# Altium schematic sheet Side_PCB_v1.0.SchDoc
size A4; SheetNumber: 2; SheetTotal: 2
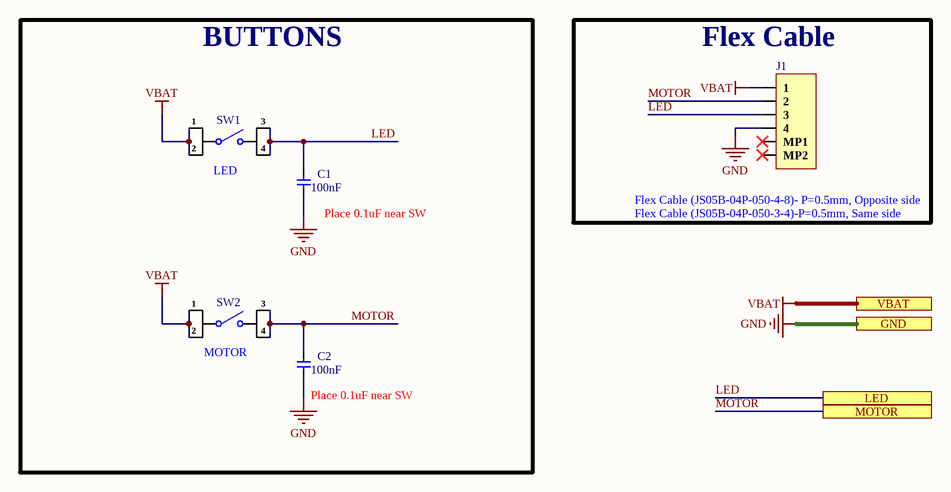
[diagram p0: Side_PCB_v1.0.SchDoc]

## Parts
C1  100nF  [CAP-0201]
C2  100nF  [CAP-0201]
J1  FH19C-4S-0.5SH(10)  [FH19C-4S-0.5SH(10)]  (value not drawn)
SW1  GT-TC025D-H0065-L1  [GT-TC025D-H0065-L1.]  (value not drawn)
SW2  GT-TC025D-H0065-L1  [GT-TC025D-H0065-L1.]  (value not drawn)

## Blocks framed on the sheet
BUTTONS: C1 C2 SW1 SW2
Flex Cable: J1

## Ports
GND, LED, MOTOR, VBAT

## Nets
GND: C1.1 C2.1 J1.4 ; port GND
VBAT: J1.1 SW1.1 SW1.2 SW2.1 SW2.2 ; port VBAT
LED: C1.2 J1.3 SW1.3 SW1.4 ; port LED
MOTOR: C2.2 J1.2 SW2.3 SW2.4 ; port MOTOR

Not connected (* = marked no-connect by the designer): J1 MP1* MP2*

## Notes on the sheet
- (near SW1) LED
- (near C1) Place 0.1uF near SW
- (near J1) Flex Cable (JS05B-04P-050-4-8)- P=0.5mm, Opposite side
- (near J1) Flex Cable (JS05B-04P-050-3-4)-P=0.5mm, Same side
- (near SW2) MOTOR
- (near C2) Place 0.1uF near SW
- File:
- Title:
- Date:
- Page
- Num:
- Total:
- Drawn By: Huzaifa Ali

## Library data of the parts
C1 C2 = CC0201KRX5R6BB104: CAP CER 0.1UF 10V X5R 0201; Manufacturer: Yageo; Tolerance: 10%; Supplier 1: Mouser; Manufacturer Part Number: CC0201KRX5R6BB104; RoHS: Yes; Category: Ceramic Capacitors; Stock 1: 824403; Pricing 1: 1=0.10000, 10=0.02400, 50=0.02400, 100=0.01900, 1000=0.01100, 10000=0.00900 (USD); Mount: Surface Mount; Case/Package: 0201; Case Code (Imperial): 0201; Case Code (Metric): 0603; Weight: 6E-06oz; Min Operating Temperature: -55°C; Max Operating Temperature: 85°C; Capacitance: 100nF; Packaging: Tape and Reel; Voltage Rating: 10V; Dielectric: X5R; Termination: SMD/SMT; Voltage Rating (DC): 10V; Length: 0.6mm; Width: 0.012inch; Thickness: 0.013inch; Lead Free: Lead Free; Halogen Free: Halogen Free; ComponentLink1URL: https://datasheet.ciiva.com/11587/upy-gphc-x5r-4v-to-50v-12-11587190.pdf?src-supplier=Avnet; ComponentLink1Description: https://datasheet.ciiva.com/11587/upy-gphc-x5r-4v-to-50v-12-11587190.pdf?src-supplier=Avnet; Supplier Part Number 1: 603-CC201KRX5R6BB104; LCSC Part Number: C190183; Resistor Type: Ceramic; Series: CC; Construction: Flat; Height: 0.3mm; Depth: 0.3mm; Radiation Hardening: No; RoHS Compliant: Yes
J1 = FH19C-4S-0.5SH(10): CONN FFC BOTTOM 4POS 0.5MM R/A; Manufacturer: Hirose; Actuator Material: Polymer,Polyphenylene,Liquid Crystal Polymer; Voltage Rating: 50V; Current Rating: 500mA; Number of Positions: 4; Insulation Resistance: 500MR; Wire/Cable Type: Flat Flex; Pitch: 0.02inch; Item Type: FPC Connector; Supplier 1: Digi-Key; Manufacturer Part Number: FH19C-4S-0.5SH(10); RoHS: Yes; Category: FFC / FPC; Stock 1: 7956; Pricing 1: 1=1.08, 10=0.916, 25=0.878, 50=0.8596, 100=0.8221, 250=0.7474, 500=0.67266, 1000=0.59792, 2500=0.54186 (USD); Mounting Technology: Surface Mount; Contact Material: Bronze; Contact Plating: Gold; Housing Material: Polymer; Min Operating Temperature: -55°C; Max Operating Temperature: 85°C; Packaging: Tape and Reel; Package Quantity: 5000; Termination: Solder; Series: FH19C; Flammability Rating: UL94 V-0; RoHS Compliant: Yes; ComponentLink1URL: https://datasheet.ciiva.com/18563/ed-fh19cfh19sc-20140305-18563548.pdf?src-supplier=Digi-Key; ComponentLink1Description: https://datasheet.ciiva.com/18563/ed-fh19cfh19sc-20140305-18563548.pdf?src-supplier=Digi-Key; Supplier Part Number 1: H125822CT-ND; LCSC Part Number: C424650
SW1 SW2 = GT-TC025D-H0065-L1: No NO J pin 50mA 3mm 100MΩ 100000 12V 250gf@±30gf 2.6mm -30℃~+85℃ 0.65mm Black Round Button Brick nogging SPST SMD Tactile Switches ROHS; Manufacturer: G-Switch; Manufacturer Part Number: GT-TC025D-H0065-L1; LCSC Part Number: C778132; Item Type: Tactile Switch; ComponentLink1Description: LCSC; ComponentLink1URL: https://www.lcsc.com/product-detail/Tactile-Switches_G-Switch-GT-TC025D-H0065-L1_C778132.html